# Altium schematic sheet Oscillator.SchDoc
size A4; SheetNumber: 2; SheetTotal: 2
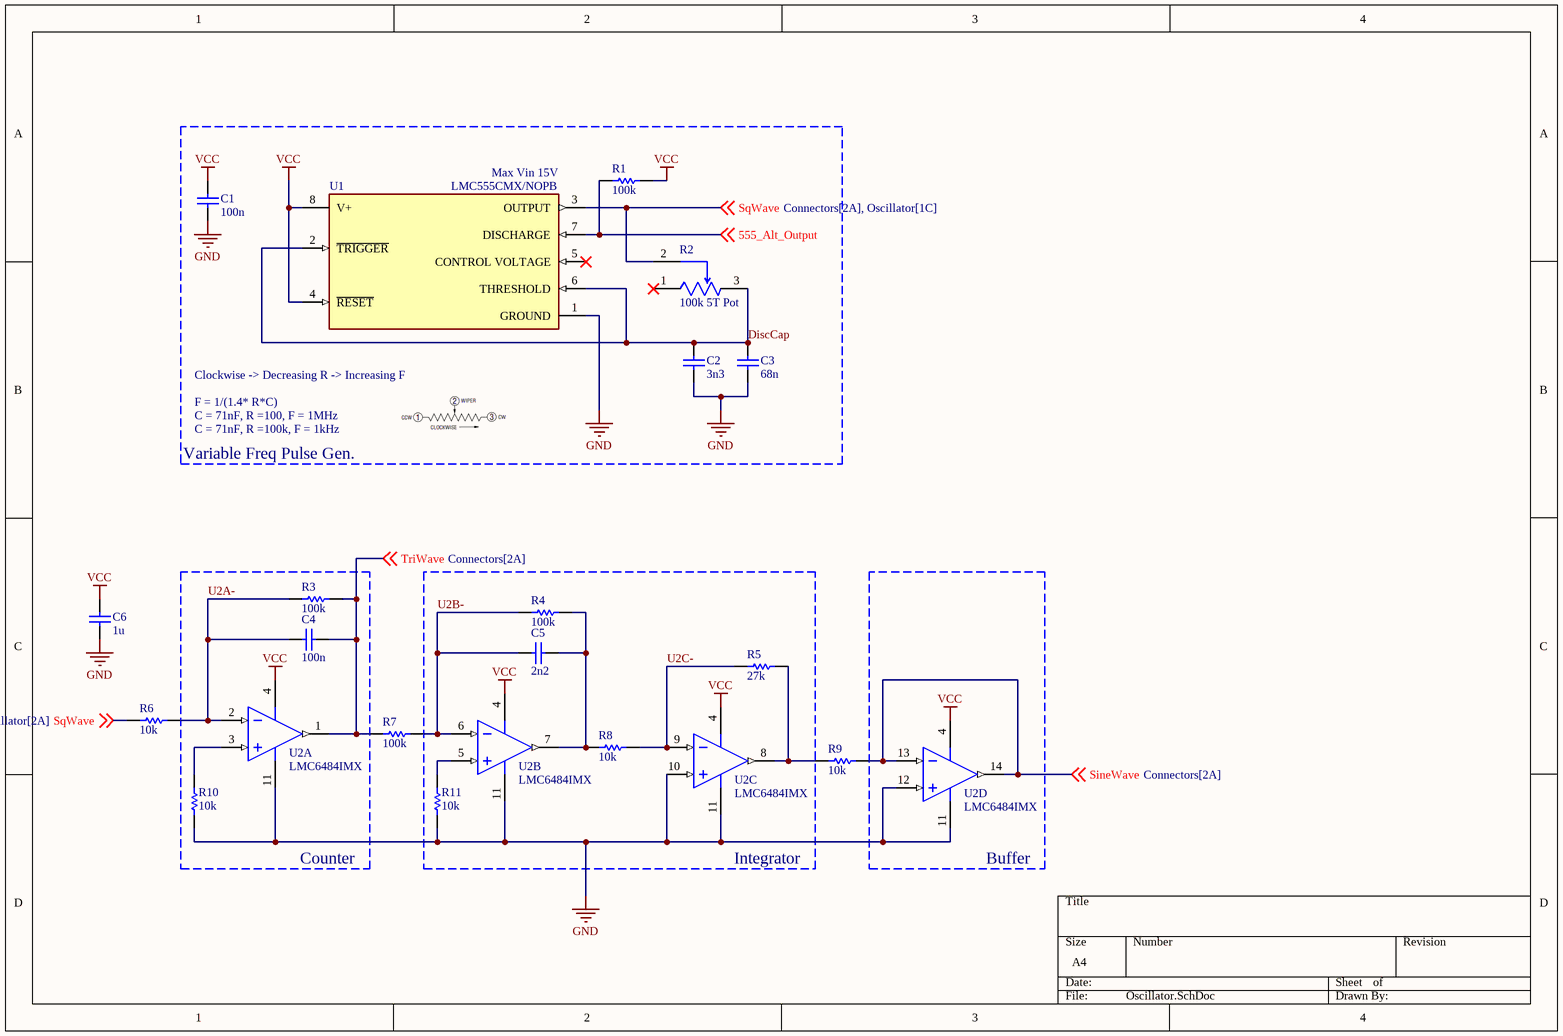
[diagram p0: Oscillator.SchDoc]

## Parts
C1  100n  [CAPC2013X145X48ML20T23]
C2  3n3  [CAPC2013X145X48ML20T23]
C3  68n  [CAPC2013X145X48ML20T23]
C4  100n  [CAPC2013X145X48ML20T23]
C5  2n2  [CAPC2013X145X48ML20T23]
C6  1u  [CAPC2013X145X48ML20T23]
R1  100k  [RESC2013X50X30ML20T20]
R2  100k 5T Pot  [FP-3214W-MFG]
R3  100k  [RESC2013X50X30ML20T20]
R4  100k  [RESC2013X50X30ML20T20]
R5  27k  [RESC2013X50X30ML20T20]
R6  10k  [RESC2013X50X30ML20T20]
R7  100k  [RESC2013X50X30ML20T20]
R8  10k  [RESC2013X50X30ML20T20]
R9  10k  [RESC2013X50X30ML20T20]
R10  10k  [RESC2013X50X30ML20T20]
R11  10k  [RESC2013X50X30ML20T20]
U1  LMC555CMX/NOPB  [FP-D0008A-MFG]
U2  LMC6484IMX  [D0014A_N]  (parts A,B,C,D of 4)

## Blocks framed on the sheet
Variable Freq Pulse Gen.: C1-C3 R1 R2 U1
Counter: C4 R3 R10 U2
Integrator: C5 R4 R5 R8 R11 U2
Buffer: U2

## Nets
GND: C1.1 C2.1 C3.1 C6.1 R10.2 R11.2 U1.1(GROUND) U2.10(IN3+) U2.11(V-) U2.12(IN4+)
VCC: C1.2 C6.2 R1.1 U1.4(~{RESET}) U1.8(V+) U2.4(V+)
555_Alt_Output: R1.2 U1.7(DISCHARGE) ; off-sheet 555_Alt_Output
DiscCap: C2.2 C3.2 R2.3(CW) U1.2(~{TRIGGER}) U1.6(THRESHOLD)
SineWave: R9.1 U2.13(IN4-) U2.14(OUT4) ; off-sheet SineWave
SqWave: R2.2(WIPER) R6.2 U1.3(OUTPUT) ; off-sheet SqWave
TriWave: C4.1 R3.1 R7.2 U2.1(OUT1) ; off-sheet TriWave
U2A-: C4.2 R3.2 R6.1 U2.2(IN1-)
U2B-: C5.2 R4.2 R7.1 U2.6(IN2-)
U2C-: R5.2 R8.1 U2.9(IN3-)
NetC5_1: C5.1 R4.1 R8.2 U2.7(OUT2)
NetR5_1: R5.1 R9.2 U2.8(OUT3)
NetR10_1: R10.1 U2.3(IN1+)
NetR11_1: R11.1 U2.5(IN2+)

Not connected (* = marked no-connect by the designer): R2 1(CCW)*; U1 5(CONTROL_VOLTAGE)*

## Notes on the sheet
- (near U1) Max Vin 15V
- Clockwise -> Decreasing R -> Increasing F
- F = 1/(1.4* R*C)
- C = 71nF, R =100, F = 1MHz
- C = 71nF, R =100k, F = 1kHz

## Library data of the parts
C1-C6 = CMP-2007-01701-1: Manufacturer: Vitramon; Part Number: VJ0805A101KXAAC
R1 R3-R11 = CMP-2001-03596-1: Part Number: CRCW08051K00FKEB; Manufacturer: Vishay Dale
R2 = CMP-2000-05577-2: TRIMMER 10K OHM 0.25W J LEAD TOP; Manufacturer: Bourns; Manufacturer Part Number: 3214W-1-103E; Value: 10kΩ; Tolerance: 10%; Voltage Rating: 300V; Standoff Height: 0.2mm; Temperature Coefficient: 100ppm/°C; Temperature: -65°C to +150°C; Digikey Description: TRIMMER 10K OHM 0.25W J LEAD TOP; RoHS: TRUE; Mouser Description: Trimmer Resistors - SMD 4mm SQ 10K OHM; ComponentLink2URL: https://www.bourns.com/docs/product-datasheets/3214.pdf?sfvrsn=62585356_13; Automotive: No; Temperature Range High: +150°C; Device Class L2: Resistors; Device Class L3: Variable Resistors and Potentiometers; Octopart: https://octopart.com/3214w-1-103e-bourns-23348; Power Rating: 0.25W; Composition: Multiturn Cermet; Package: 3214W; Height: 5.55mm; Series: 3214; Device Class L1: Passive Components; Temperature Range Low: -65°C; Lead Free: Yes; ComponentLink2Description: Datasheet; Category: Res; Resistance: 10kΩ
U1 = CMP-04858-000001-1: IC OSC SINGLE TIMER 3MHZ 8-SOIC; Manufacturer: Texas Instruments; Number Of Timers/Counters: 1; Max Supply Voltage: 15V; Standoff Height: 0.11mm; Propagation Delay: 100ns; Nominal Supply Current: 50-150uA; Min Supply Voltage: 1.5V; Octopart: https://octopart.com/lmc555cmx%2Fnopb-texas+instruments-24815227; Frequency: 3MHz; Device Class L2: Clock and Timing; Temperature: -40°C to +85°C; Temperature Range Low: -40°C; Height: 1.75mm; ComponentLink2URL: http://www.ti.com/general/docs/suppproductinfo.tsp?distId=10&gotoUrl=http%3A%2F%2Fwww.ti.com%2Flit%2Fgpn%2Flmc555; Package: D0008A; Device Class L1: Integrated Circuits (ICs); Manufacturer Part Number: LMC555CMX/NOPB; RoHS: TRUE; Lead Free: Yes; Temperature Range High: +85°C; Digikey Description: IC OSC SINGLE TIMER 3MHZ 8-SOIC; Device Class L3: Timers and Oscillators; ComponentLink2Description: Datasheet; Mouser Description: Timers & Support Products CMOS TIMER; Category: IC; Ipc Land Pattern Name: SOIC127P600X175-8; Automotive: No
U2 = CMP-0055-00813-3: CMOS Quad Rail to Rail Input and Output Operational Amplifier, 14-pin Narrow SOIC; Manufacturer: Texas Instruments; PackageTopMarking: NSUZXYTTE#*LMC6484IM; PowerWise: N; CompType: Amplifiers; PackageDescription: Molded Package S.O., .150in Wide, 14 Lead; Package Reference: D0014A; RoHS: N; PinCount: 14; ComponentLink1URL: http://www.ti.com/general/docs/lit/getliterature.tsp?genericPartNumber=LMC6484&fileType=pdf; ComponentLink1Description: Datasheet URL; Code_JEDEC: MS-012AB; Code_IPC: SOIC127P600-14